# Altium schematic sheet Sheet2.SchDoc
size A4; SheetNumber: 2; SheetTotal: 3
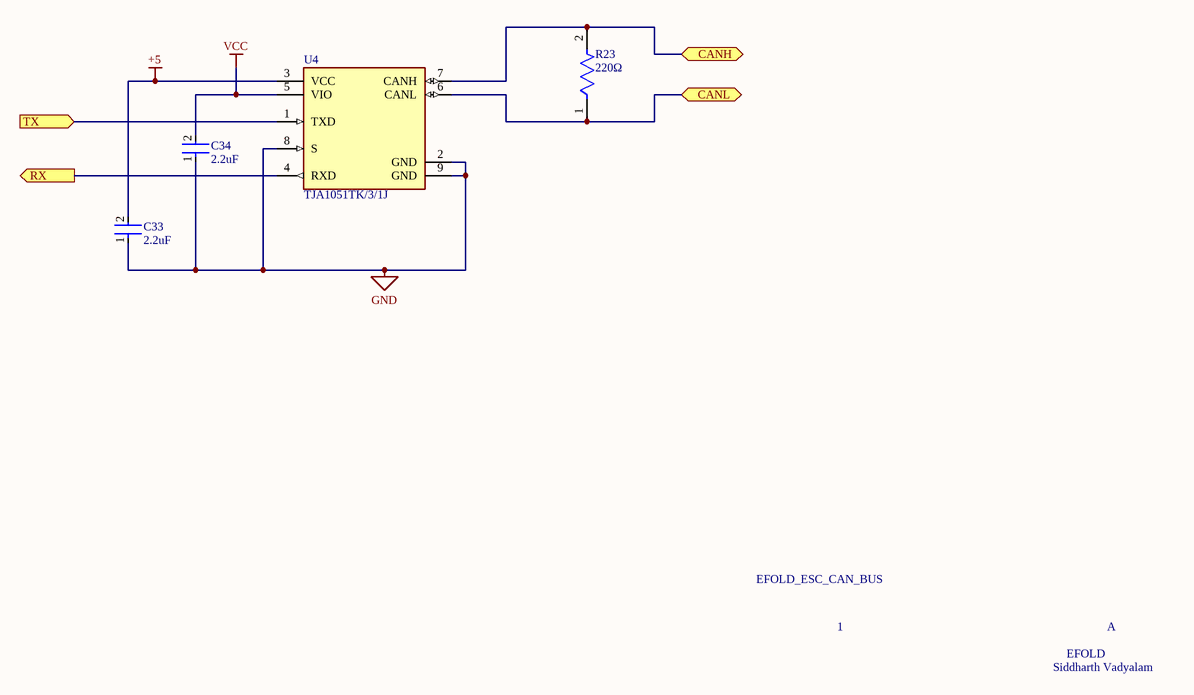
[diagram p0: Sheet2.SchDoc]

## Parts
C33  2.2uF  [FP-GRM188-0_1-e0_2_0_5-MFG]
C34  2.2uF  [FP-GRM188-0_1-e0_2_0_5-MFG]
R23  220Ω  [FP-CRGP0603-IPC_C]
U4  TJA1051TK/3/1J  [FP-SOT782-1-MFG]

## Ports
CANH (bidir), CANL (bidir), RX (out), TX (in)

## Nets
+5: C33.2 U4.3(VCC)
GND: C33.1 C34.1 U4.2(GND) U4.8(S) U4.9(GND)
VCC: C34.2 U4.5(VIO)
CANH: R23.2 U4.7(CANH) ; port CANH
CANL: R23.1 U4.6(CANL) ; port CANL
RX: U4.4(RXD) ; port RX
TX: U4.1(TXD) ; port TX

## Notes on the sheet
- EFOLD_ESC_CAN_BUS
- 1
- EFOLD
- A
- Siddharth Vadyalam

## Library data of the parts
C33 C34 = CMP-2006-02836-2: Chip Multilayer Ceramic Capacitors for General Purpose, 0603, 2.2uF, X7R, 15%, 10%, 10V; Case Code (Metric): 1608; Height: 0.8mm; Packaging: Cut Tape; Voltage: 10V; Lead Free: Lead Free; Min Operating Temperature: -55°C; Voltage Rating (DC): 10V; Max Operating Temperature: 125°C; Voltage Rating: 10V; Dielectric: X7R; Depth: 0.8mm; Case Code (Imperial): 0603; Termination: SMD/SMT; Case/Package: 0603; Number of Pins: 2; REACH SVHC: No SVHC; Mount: Surface Mount; Width: 0.031inch; Material: Ceramic; Capacitance: 2.2uF; Package Quantity: 1; Weight: 7.1E-05oz; Length: 1.6mm; Thickness: 0.035inch; Tolerance: 10%
R23 = CMP-03211-006860-1: CRGP 0603 220R 1%; Manufacturer Part Number: CRGP0603F220R; Manufacturer: TE; Tolerance: 0.01; Voltage Rating: 50V; Power Rating: 0.25W; Temperature Coefficient: ±100ppm/°C; Device Class L3: Chip SMD Resistors; Digikey Description: CRGP 0603 220R 1%; Device Class L2: Resistors; Resistance: 220Ω; Series: CRGP; Lead Free: Yes; Value: 220Ω; Ambient Temperature Range High: +70°C; Package: CRGP0603; Composition: Thick Film; Category: Res; Device Class L1: Passive Components; Temperature: -55°C to +155°C; ComponentLink2URL: https://www.te.com/commerce/DocumentDelivery/DDEController?Action=srchrtrv&DocNm=9-1773463-9&DocType=DS&DocLang=English; Temperature Range High: +155°C; Temperature Range Low: -55°C; RoHS: TRUE; Ipc Land Pattern Name: RESC16080X45; Height: 0.55mm; ComponentLink2Description: Datasheet; Octopart: https://octopart.com/crgp0603f220r-te+connectivity-91018741; Automotive: No
U4 = CMP-10098-000001-1: IC TRANSCEIVER HALF 1/1 8HVSON; Manufacturer: NXP; Standoff Height: 0mm; Max Junction Temp: +150°C; Min Supply Voltage: 2.8V; Max Supply Voltage: 5.5V; Automotive Grade: Grade 0; Nominal Supply Current: 5-80mA; Interface: CAN; Temperature Range High: +150°C; Footprint Url: https://www.nxp.com/docs/en/package-information/SOT782-1.pdf; Ipc Land Pattern Name: DFN300X300X85-8; RoHS: TRUE; Mouser Description: TJA1051 Single 5 V 1 MBd Surface Mount High Speed CAN Transceiver - HVSON-8; Height: 1mm; Device Class L1: Integrated Circuits (ICs); Temperature: -40°C to +150°C; Temperature Range Low: -40°C; Manufacturer Part Number: TJA1051TK/3/1J; Category: IC; Octopart: https://octopart.com/tja1051tk%2F3%2F1j-nxp+semiconductors-47257182; Lead Free: Yes; ComponentLink2Description: Datasheet; Automotive: Yes; ComponentLink2URL: https://www.nxp.com/docs/en/data-sheet/TJA1051.pdf; Package: SOT782-1; Device Class L3: unset; Device Class L2: Interface ICs; Digikey Description: IC TRANSCEIVER HALF 1/1 8HVSON